# Altium schematic sheet E15-UTL1-SCH.SchDoc
size A4
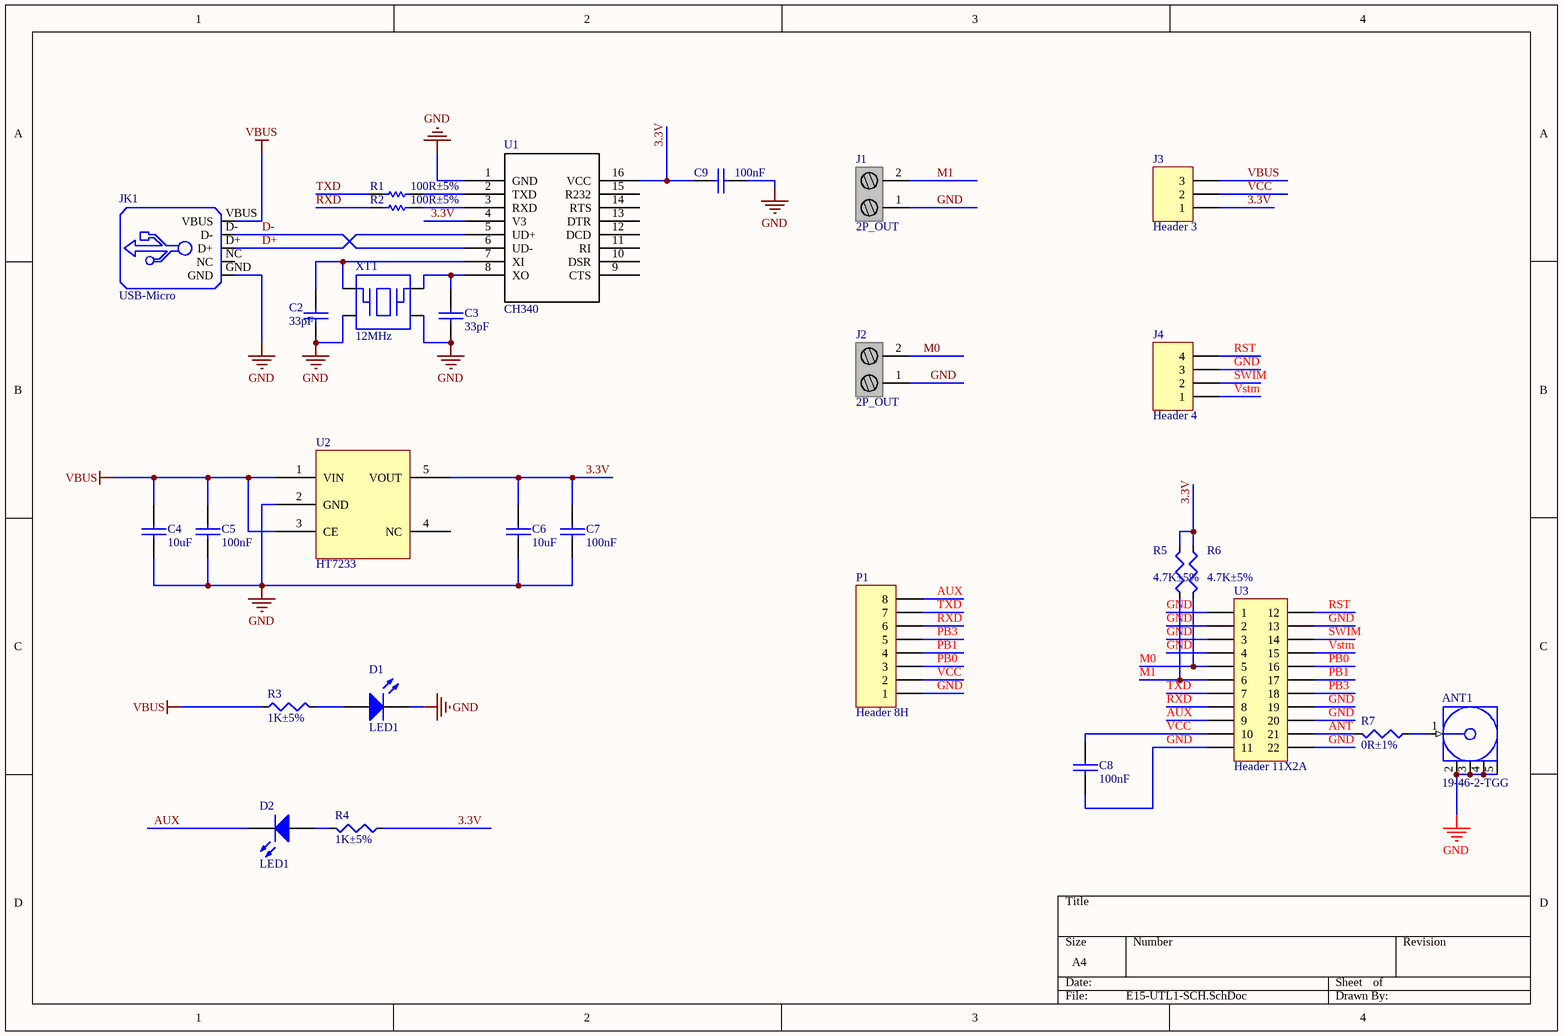
[diagram p0: E15-UTL1-SCH.SchDoc]

## Parts
ANT1  19-46-2-TGG  [PCBComponent_1]
C2  33pF  [0402A-C]
C3  33pF  [0402A-C]
C4  10uF  [0603]
C5  100nF  [0402A-C]
C6  10uF  [0603]
C7  100nF  [0402A-C]
C8  100nF  [0402A-C]
C9  100nF  [0402A-C]
D1  LED1  [0805LED1]
D2  LED1  [0805LED1]
J1  2P_OUT  [HDR1X2]
J2  2P_OUT  [HDR1X2]
J3  Header 3  [HDR1X3]
J4  Header 4  [4P-1.27MM]
JK1  USB-Micro  [Micro USB-5SB]
P1  Header 8H  [HDR1X8]
R1  100R±5%  [0402A-C]
R2  100R±5%  [0402A-C]
R3  1K±5%  [0402A-C]
R4  1K±5%  [0402A-C]
R5  4.7K±5%  [0402A-C]
R6  4.7K±5%  [0402A-C]
R7  0R±1%  [0402A-C]
U1  CH340  [SOP16/6.0]
U2  HT7233  [SOT23-5AN]
U3  Header 11X2A  [E45-868T20S]
XT1  12MHz  [XT3225]

## Nets
GND: ANT1.2(GND) ANT1.3(GND) ANT1.4(GND) ANT1.5(GND) C2.1 C3.1 C4.2 C5.2 C6.2 C7.2 C8.2 C9.2 D1.2(K) J1.1(VDD) J2.1(VDD) J4.3 JK1.GND P1.1 U1.1(GND) U2.2(GND) U3.1 U3.2 U3.3 U3.4 U3.11 U3.13 U3.19 U3.20 U3.22 XT1.3 XT1.4
VBUS: C4.1 C5.1 J3.3 JK1.VBUS R3.1 U2.1(VIN) U2.3(CE)
3.3V: C6.1 C7.1 C9.1 J3.1 R4.1 R5.2 R6.1 U1.4(V3) U1.16(VCC) U2.5(VOUT)
ANT: R7.2 U3.21
AUX: D2.2(K) P1.8 U3.9
D+: JK1.D+ U1.5(UD+)
D-: JK1.D- U1.6(UD-)
M0: J2.2(VDD) R6.2 U3.5
M1: J1.2(VDD) R5.1 U3.6
PB0: P1.3 U3.16
PB1: P1.4 U3.17
PB3: P1.5 U3.18
RST: J4.4 U3.12
RXD: P1.6 R2.1 U3.8
SWIM: J4.2 U3.14
TXD: P1.7 R1.1 U3.7
VCC: C8.1 J3.2 P1.2 U3.10
Vstm: J4.1 U3.15
NetANT1_1: ANT1.1(Signal) R7.1
NetC2_2: C2.2 U1.7(XI) XT1.1
NetC3_2: C3.2 U1.8(XO) XT1.2
NetD1_1: D1.1(A) R3.2
NetD2_1: D2.1(A) R4.2
NetR1_2: R1.2 U1.2(TXD)
NetR2_2: R2.2 U1.3(RXD)

Not connected (* = marked no-connect by the designer): JK1 NC; U1 9(CTS) 10(DSR) 11(RI) 12(DCD) 13(DTR) 14(RTS) 15(R232); U2 4(NC)

## Library data of the parts
ANT1 = 19-46-2-TGG: SMA RF Coaxial PCB Connector, SM, Vertical Mount Socket, 50 Ohm Impedance; Published: 12-Dec-2006; DatasheetVersion: rev.A-0, Jul-2002; PackageVersion: rev.A-0, Jul-2002; PackageReference: 19-46-2; Publisher: Altium Limited; PackageDescription: SMA Straight PCB Surface Mount Jack Receptacle; ComponentLink1Description: Manufacturer Link; ComponentLink1URL: http://www.chinnan.com.tw/
C2 C3 C9 = CAP: Capacitor
C4-C8 = cap0603: Capacitor
D1 D2 = LED1: Typical RED GaAs LED; Published: 8-Jun-2000; LatestRevisionDate: 08-Jul-2005; LatestRevisionNote: Mech Layer 1 removed.; PackageReference: LED-1; Publisher: Altium Limited; PackageDescription: LED; 2 Leads
J3 = Header 3: Header, 3-Pin; LatestRevisionDate: 17-Jul-2002; LatestRevisionNote: Re-released for DXP Platform.; Publisher: Altium Limited
J4 = Header 4: Header, 4-Pin; LatestRevisionDate: 17-Jul-2002; LatestRevisionNote: Re-released for DXP Platform.; Publisher: Altium Limited
JK1 = USB-MINI
P1 = Header 8H: Header, 8-Pin, Right Angle; LatestRevisionDate: 17-Jul-2002; LatestRevisionNote: Re-released for DXP Platform.; Publisher: Altium Limited
R1 R2 = RES1
R3-R7 = res0603
U1 = CH340G
U3 = Header 11X2A: Header, 11-Pin, Dual row; LatestRevisionDate: 17-Jul-2002; LatestRevisionNote: Re-released for DXP Platform.; Publisher: Altium Limited
XT1 = XT-SMD1